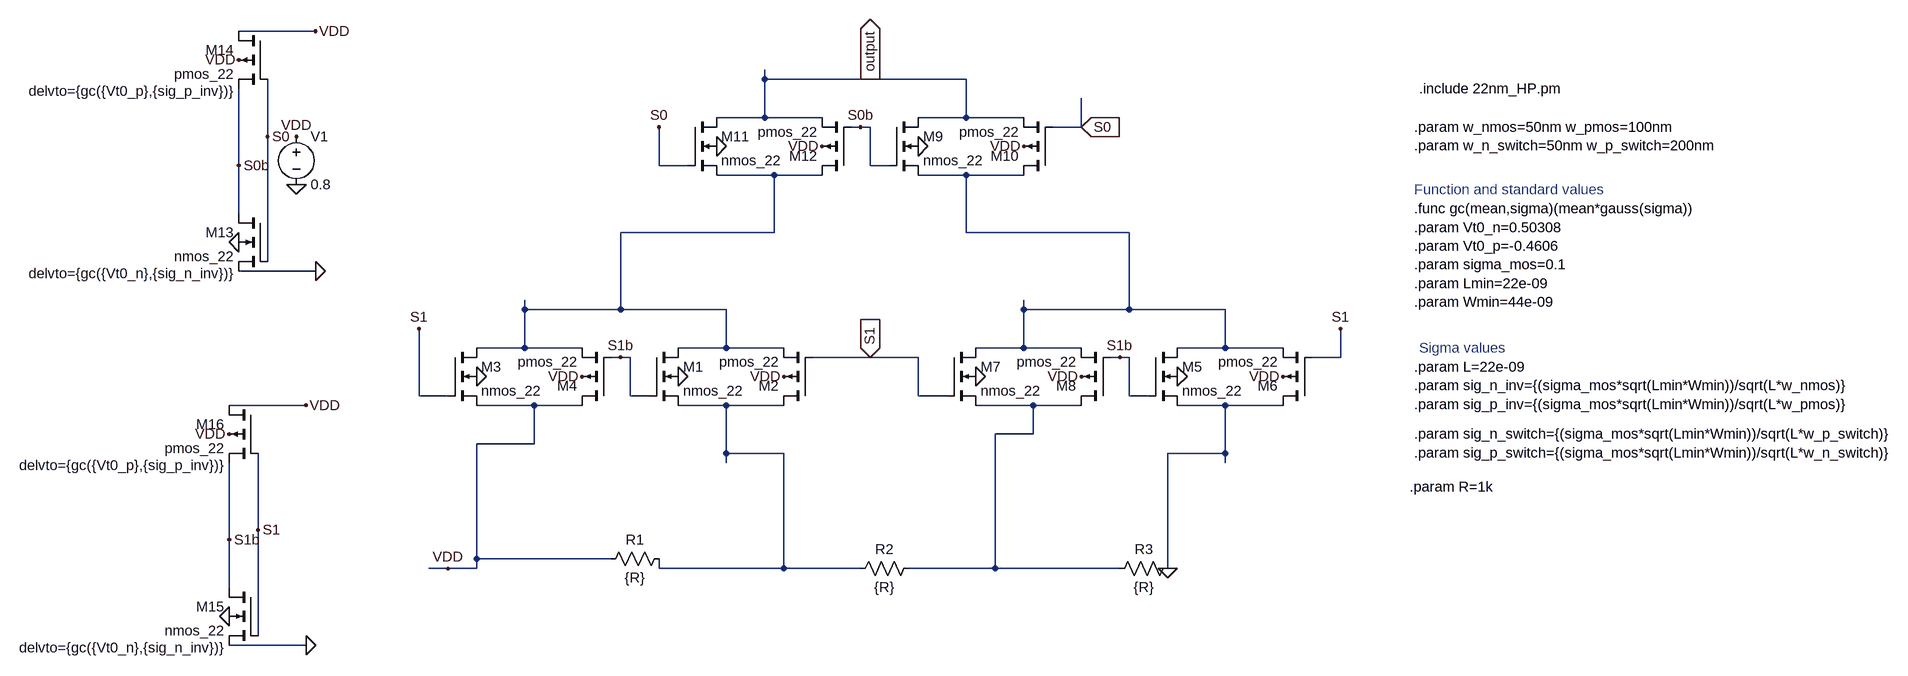
[diagram p0: schematic DAC.asc]
DAC.asc, the LTspice schematic file:
Version 4.1
SHEET 1 2632 1040
WIRE -528 -384 -656 -384
WIRE 352 -304 352 -320
WIRE 528 -304 352 -304
WIRE 688 -304 528 -304
WIRE 352 -240 352 -304
WIRE 352 -240 272 -240
WIRE 448 -240 352 -240
WIRE 688 -240 688 -304
WIRE 688 -240 608 -240
WIRE 784 -240 688 -240
WIRE 512 -224 496 -224
WIRE 528 -224 512 -224
WIRE 880 -224 880 -272
WIRE 880 -224 832 -224
WIRE -608 -208 -608 -304
WIRE -656 -160 -656 -288
WIRE 176 -160 176 -224
WIRE 224 -160 176 -160
WIRE 528 -160 528 -224
WIRE 560 -160 528 -160
WIRE 368 -144 272 -144
WIRE 448 -144 368 -144
WIRE 688 -144 608 -144
WIRE 784 -144 688 -144
WIRE -656 -80 -656 -160
WIRE 368 -48 368 -144
WIRE 368 -48 112 -48
WIRE 688 -48 688 -144
WIRE 960 -48 688 -48
WIRE -608 0 -608 -208
WIRE -528 16 -656 16
WIRE -48 80 -48 64
WIRE 112 80 112 -48
WIRE 112 80 -48 80
WIRE 288 80 112 80
WIRE 784 80 784 64
WIRE 960 80 960 -48
WIRE 960 80 784 80
WIRE 1120 80 960 80
WIRE -48 144 -48 80
WIRE -48 144 -128 144
WIRE 48 144 -48 144
WIRE 288 144 288 80
WIRE 288 144 208 144
WIRE 384 144 288 144
WIRE 784 144 784 80
WIRE 784 144 704 144
WIRE 880 144 784 144
WIRE 1120 144 1120 80
WIRE 1120 144 1040 144
WIRE 1216 144 1120 144
WIRE 112 160 96 160
WIRE 128 160 112 160
WIRE 528 160 432 160
WIRE 608 160 528 160
WIRE 944 160 928 160
WIRE 960 160 944 160
WIRE 1312 160 1312 112
WIRE 1312 160 1264 160
WIRE -224 224 -224 112
WIRE -176 224 -224 224
WIRE 128 224 128 160
WIRE 160 224 128 224
WIRE 608 224 608 160
WIRE 656 224 608 224
WIRE 960 224 960 160
WIRE 992 224 960 224
WIRE -544 240 -672 240
WIRE -32 240 -128 240
WIRE 48 240 -32 240
WIRE 288 240 208 240
WIRE 384 240 288 240
WIRE 800 240 704 240
WIRE 880 240 800 240
WIRE 1120 240 1040 240
WIRE 1216 240 1120 240
WIRE 800 288 800 240
WIRE 800 288 736 288
WIRE -32 304 -32 240
WIRE -32 304 -128 304
WIRE 288 320 288 240
WIRE 384 320 288 320
WIRE 1120 320 1120 240
WIRE 1120 320 1024 320
WIRE 288 336 288 320
WIRE 1120 336 1120 320
WIRE -624 448 -624 320
WIRE -672 464 -672 336
WIRE -128 496 -128 304
WIRE 96 496 -128 496
WIRE -176 512 -208 512
WIRE -128 512 -128 496
WIRE -128 512 -176 512
WIRE 176 512 176 496
WIRE 384 512 384 320
WIRE 384 512 176 512
WIRE 512 512 384 512
WIRE 736 512 736 288
WIRE 736 512 592 512
WIRE 944 512 736 512
WIRE 1024 512 1024 320
WIRE -672 544 -672 464
WIRE -624 624 -624 448
WIRE -544 640 -672 640
FLAG 208 192 0
FLAG 384 192 VDD
FLAG -128 192 0
FLAG 48 192 VDD
FLAG 1040 192 0
FLAG 1216 192 VDD
FLAG 704 192 0
FLAG 880 192 VDD
FLAG 608 -192 0
FLAG 784 -192 VDD
FLAG 272 -192 0
FLAG 448 -192 VDD
FLAG 880 -224 S0
IOPIN 880 -224 In
FLAG 528 160 S1
IOPIN 528 160 In
FLAG -528 -384 VDD
FLAG -656 -336 VDD
FLAG -656 -32 0
FLAG -528 16 0
FLAG -560 -128 0
FLAG -560 -208 VDD
FLAG -544 240 VDD
FLAG -672 288 VDD
FLAG -672 592 0
FLAG -544 640 0
FLAG -608 -208 S0
FLAG -656 -160 S0b
FLAG -672 464 S1b
FLAG -624 448 S1
FLAG 1024 512 0
FLAG 528 -304 output
IOPIN 528 -304 Out
FLAG 176 -224 S0
FLAG 512 -224 S0b
FLAG -224 112 S1
FLAG 1312 112 S1
FLAG 944 160 S1b
FLAG 112 160 S1b
FLAG -176 512 VDD
SYMBOL nmos4 160 144 R0
SYMATTR Value2 l=22nm w={w_n_switch} delvto={gc({Vt0_n},{sig_n_switch})}
SYMATTR InstName M1
SYMATTR Value nmos_22
SYMBOL pmos4 432 240 R180
SYMATTR Value2 l=22nm w={w_p_switch} delvto={gc({Vt0_p},{sig_p_switch})}
SYMATTR InstName M2
SYMATTR Value pmos_22
SYMBOL nmos4 -176 144 R0
SYMATTR Value2 l=22nm w={w_n_switch} delvto={gc({Vt0_n},{sig_n_switch})}
SYMATTR InstName M3
SYMATTR Value nmos_22
SYMBOL pmos4 96 240 R180
SYMATTR InstName M4
SYMATTR Value pmos_22
SYMATTR Value2 l=22nm w={w_p_switch} delvto={gc({Vt0_p},{sig_p_switch})}
SYMBOL nmos4 992 144 R0
SYMATTR Value2 l=22nm w={w_n_switch} delvto={gc({Vt0_n},{sig_n_switch})}
SYMATTR InstName M5
SYMATTR Value nmos_22
SYMBOL pmos4 1264 240 R180
SYMATTR Value2 l=22nm w={w_p_switch} delvto={gc({Vt0_p},{sig_p_switch})}
SYMATTR InstName M6
SYMATTR Value pmos_22
SYMBOL nmos4 656 144 R0
SYMATTR Value2 l=22nm w={w_n_switch} delvto={gc({Vt0_n},{sig_n_switch})}
SYMATTR InstName M7
SYMATTR Value nmos_22
SYMBOL pmos4 928 240 R180
SYMATTR InstName M8
SYMATTR Value pmos_22
SYMATTR Value2 l=22nm w={w_p_switch} delvto={gc({Vt0_p},{sig_p_switch})}
SYMBOL nmos4 560 -240 R0
SYMATTR Value2 l=22nm w={w_n_switch} delvto={gc({Vt0_n},{sig_n_switch})}
SYMATTR InstName M9
SYMATTR Value nmos_22
SYMBOL pmos4 832 -144 R180
SYMATTR Value2 l=22nm w={w_p_switch} delvto={gc({Vt0_p},{sig_p_switch})}
SYMATTR InstName M10
SYMATTR Value pmos_22
SYMBOL nmos4 224 -240 R0
SYMATTR Value2 l=22nm w={w_n_switch} delvto={gc({Vt0_n},{sig_n_switch})}
SYMATTR InstName M11
SYMATTR Value nmos_22
SYMBOL pmos4 496 -144 R180
SYMATTR InstName M12
SYMATTR Value pmos_22
SYMATTR Value2 l=22nm w={w_p_switch} delvto={gc({Vt0_p},{sig_p_switch})}
SYMBOL nmos4 -608 -80 M0
WINDOW 39 56 100 Left 2
SYMATTR SpiceLine delvto={gc({Vt0_n},{sig_n_inv})}
SYMATTR InstName M13
SYMATTR Value nmos_22
SYMATTR Value2 l=22nm w={w_nmos}
SYMBOL pmos4 -608 -384 M0
WINDOW 39 56 100 Left 2
SYMATTR SpiceLine delvto={gc({Vt0_p},{sig_p_inv})}
SYMATTR InstName M14
SYMATTR Value pmos_22
SYMATTR Value2 l=22nm w={w_pmos}
SYMBOL voltage -560 -224 R0
WINDOW 123 0 0 Left 0
WINDOW 39 0 0 Left 0
SYMATTR InstName V1
SYMATTR Value 0.8
SYMBOL nmos4 -624 544 M0
WINDOW 39 56 100 Left 2
SYMATTR SpiceLine delvto={gc({Vt0_n},{sig_n_inv})}
SYMATTR InstName M15
SYMATTR Value nmos_22
SYMATTR Value2 l=22nm w={w_nmos}
SYMBOL pmos4 -624 240 M0
WINDOW 39 56 100 Left 2
SYMATTR SpiceLine delvto={gc({Vt0_p},{sig_p_inv})}
SYMATTR InstName M16
SYMATTR Value pmos_22
SYMATTR Value2 l=22nm w={w_pmos}
SYMBOL res 192 480 R90
WINDOW 0 0 56 VBottom 2
WINDOW 3 32 56 VTop 2
SYMATTR InstName R1
SYMATTR Value {R}
SYMBOL res 608 496 R90
WINDOW 0 0 56 VBottom 2
WINDOW 3 32 56 VTop 2
SYMATTR InstName R2
SYMATTR Value {R}
SYMBOL res 1040 496 R90
WINDOW 0 0 56 VBottom 2
WINDOW 3 32 56 VTop 2
SYMATTR InstName R3
SYMATTR Value {R}
TEXT 1712 376 Left 2 !.param R=1k
TEXT 1720 -224 Left 2 !.param w_nmos=50nm w_pmos=100nm\n.param w_n_switch=50nm w_p_switch=200nm
TEXT 1720 -88 Left 2 !.func gc(mean,sigma)(mean*gauss(sigma))\n.param Vt0_n=0.50308\n.param Vt0_p=-0.4606\n.param sigma_mos=0.1\n.param Lmin=22e-09\n.param Wmin=44e-09
TEXT 1720 176 Left 2 !.param L=22e-09\n.param sig_n_inv={(sigma_mos*sqrt(Lmin*Wmin))/sqrt(L*w_nmos)}\n.param sig_p_inv={(sigma_mos*sqrt(Lmin*Wmin))/sqrt(L*w_pmos)}
TEXT 1720 -120 Left 2 ;Function and standard values
TEXT 1728 144 Left 2 ;Sigma values
TEXT 1720 288 Left 2 !.param sig_n_switch={(sigma_mos*sqrt(Lmin*Wmin))/sqrt(L*w_p_switch)}\n.param sig_p_switch={(sigma_mos*sqrt(Lmin*Wmin))/sqrt(L*w_n_switch)}
TEXT 1728 -288 Left 2 !.include 22nm_HP.pm

The netlist it stands for:
* DAC.asc
M1 N001 S1b N003 0 nmos_22 l=22nm w={w_n_switch} delvto={gc({Vt0_n},{sig_n_switch})}
M2 N003 S1 N001 VDD pmos_22 l=22nm w={w_p_switch} delvto={gc({Vt0_p},{sig_p_switch})}
M3 N001 S1 VDD 0 nmos_22 l=22nm w={w_n_switch} delvto={gc({Vt0_n},{sig_n_switch})}
M4 VDD S1b N001 VDD pmos_22 l=22nm w={w_p_switch} delvto={gc({Vt0_p},{sig_p_switch})}
M5 N002 S1b 0 0 nmos_22 l=22nm w={w_n_switch} delvto={gc({Vt0_n},{sig_n_switch})}
M6 0 S1 N002 VDD pmos_22 l=22nm w={w_p_switch} delvto={gc({Vt0_p},{sig_p_switch})}
M7 N002 S1 N004 0 nmos_22 l=22nm w={w_n_switch} delvto={gc({Vt0_n},{sig_n_switch})}
M8 N004 S1b N002 VDD pmos_22 l=22nm w={w_p_switch} delvto={gc({Vt0_p},{sig_p_switch})}
M9 output S0b N002 0 nmos_22 l=22nm w={w_n_switch} delvto={gc({Vt0_n},{sig_n_switch})}
M10 N002 S0 output VDD pmos_22 l=22nm w={w_p_switch} delvto={gc({Vt0_p},{sig_p_switch})}
M11 output S0 N001 0 nmos_22 l=22nm w={w_n_switch} delvto={gc({Vt0_n},{sig_n_switch})}
M12 N001 S0b output VDD pmos_22 l=22nm w={w_p_switch} delvto={gc({Vt0_p},{sig_p_switch})}
M13 S0b S0 0 0 nmos_22 l=22nm w={w_nmos} delvto={gc({Vt0_n},{sig_n_inv})}
M14 VDD S0 S0b VDD pmos_22 l=22nm w={w_pmos} delvto={gc({Vt0_p},{sig_p_inv})}
V1 VDD 0 0.8
M15 S1b S1 0 0 nmos_22 l=22nm w={w_nmos} delvto={gc({Vt0_n},{sig_n_inv})}
M16 VDD S1 S1b VDD pmos_22 l=22nm w={w_pmos} delvto={gc({Vt0_p},{sig_p_inv})}
R1 N003 VDD {R}
R2 N004 N003 {R}
R3 0 N004 {R}
.model NMOS NMOS
.model PMOS PMOS
.lib standard.mos
.param R=1k
.param w_nmos=50nm w_pmos=100nm
.param w_n_switch=50nm w_p_switch=200nm
.func gc(mean,sigma)(mean*gauss(sigma))
.param Vt0_n=0.50308
.param Vt0_p=-0.4606
.param sigma_mos=0.1
.param Lmin=22e-09
.param Wmin=44e-09
.param L=22e-09
.param sig_n_inv={(sigma_mos*sqrt(Lmin*Wmin))/sqrt(L*w_nmos)}
.param sig_p_inv={(sigma_mos*sqrt(Lmin*Wmin))/sqrt(L*w_pmos)}
* Function and standard values
* Sigma values
.param sig_n_switch={(sigma_mos*sqrt(Lmin*Wmin))/sqrt(L*w_p_switch)}
.param sig_p_switch={(sigma_mos*sqrt(Lmin*Wmin))/sqrt(L*w_n_switch)}
.include 22nm_HP.pm
.backanno
.end